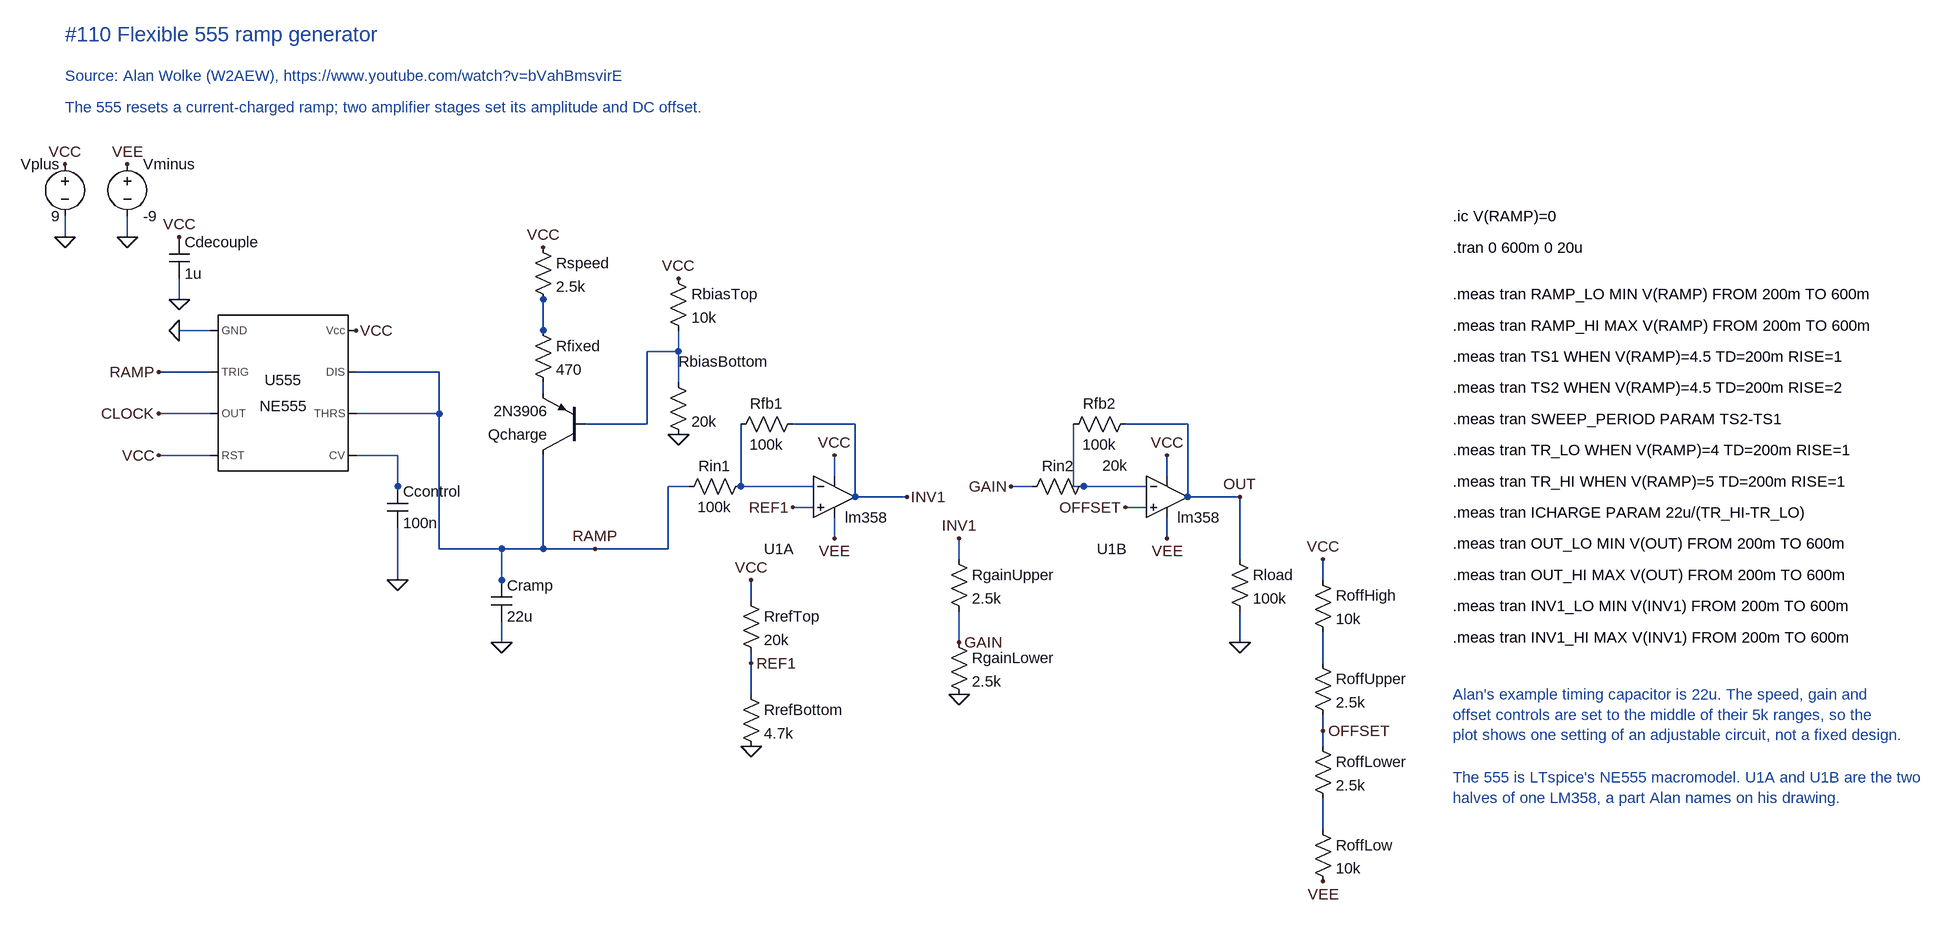
[diagram p0: schematic Flexible 555 ramp generator.asc]
Flexible 555 ramp generator.asc, the LTspice schematic file:
Version 4.1
SHEET 1 2120 1540
WIRE 64 80 64 48
WIRE 160 80 160 48
WIRE 240 96 240 80
WIRE 240 176 240 144
WIRE 288 224 240 224
WIRE 288 288 208 288
WIRE 288 352 208 352
WIRE 288 416 208 416
WIRE 512 288 640 288
WIRE 640 352 640 288
WIRE 640 352 512 352
WIRE 640 560 640 352
WIRE 736 560 640 560
WIRE 992 560 800 560
WIRE 992 560 992 464
WIRE 800 560 800 416
WIRE 800 560 736 560
WIRE 736 624 736 560
WIRE 576 416 512 416
WIRE 576 480 576 416
WIRE 576 608 576 528
WIRE 736 704 736 672
WIRE 800 176 800 224
WIRE 800 320 800 304
WIRE 800 224 800 176
WIRE 1008 256 960 256
WIRE 960 368 960 256
WIRE 960 368 864 368
WIRE 1008 256 1008 224
WIRE 1008 304 1008 256
WIRE 1024 464 992 464
WIRE 1216 464 1104 464
WIRE 1104 464 1104 368
WIRE 1280 368 1184 368
WIRE 1280 480 1280 368
WIRE 1280 480 1360 480
WIRE 1216 496 1184 496
WIRE 1248 448 1248 416
WIRE 1248 544 1248 512
WIRE 1440 576 1440 544
WIRE 1440 704 1440 656
WIRE 1552 464 1520 464
WIRE 1728 464 1632 464
WIRE 1616 464 1616 368
WIRE 1632 464 1616 464
WIRE 1792 368 1696 368
WIRE 1792 480 1792 368
WIRE 1792 480 1872 480
WIRE 1728 496 1696 496
WIRE 1760 448 1760 416
WIRE 1760 544 1760 512
WIRE 1872 576 1872 480
WIRE 1872 704 1872 656
WIRE 1120 640 1120 608
WIRE 1120 736 1120 720
WIRE 1120 784 1120 736
WIRE 2000 608 2000 576
WIRE 2000 736 2000 688
WIRE 2000 864 2000 816
WIRE 2000 992 2000 944
FLAG 64 -32 VCC
FLAG 64 80 0
FLAG 160 -32 VEE
FLAG 160 80 0
FLAG 240 80 VCC
FLAG 240 176 0
FLAG 240 224 0
FLAG 208 288 RAMP
FLAG 208 352 CLOCK
FLAG 208 416 VCC
FLAG 512 224 VCC
FLAG 576 608 0
FLAG 736 704 0
FLAG 800 96 VCC
FLAG 1008 144 VCC
FLAG 1008 384 0
FLAG 880 560 RAMP
FLAG 1184 496 REF1
FLAG 1248 416 VCC
FLAG 1248 544 VEE
FLAG 1360 480 INV1
FLAG 1440 544 INV1
FLAG 1440 704 GAIN
FLAG 1440 784 0
FLAG 1520 464 GAIN
FLAG 1696 496 OFFSET
FLAG 1760 416 VCC
FLAG 1760 544 VEE
FLAG 1872 480 OUT
FLAG 1872 704 0
FLAG 1120 608 VCC
FLAG 1120 736 REF1
FLAG 1120 864 0
FLAG 2000 576 VCC
FLAG 2000 840 OFFSET
FLAG 2000 1072 VEE
SYMBOL voltage 64 -48 R0
WINDOW 0 -8 16 Right 2
WINDOW 3 -8 96 Right 2
SYMATTR InstName Vplus
SYMATTR Value 9
SYMBOL voltage 160 -48 R0
SYMATTR InstName Vminus
SYMATTR Value -9
SYMBOL cap 224 80 R0
SYMATTR InstName Cdecouple
SYMATTR Value 1u
SYMBOL Misc\NE555 400 320 R0
SYMATTR InstName U555
SYMATTR Value NE555
SYMBOL cap 560 464 R0
SYMATTR InstName Ccontrol
SYMATTR Value 100n
SYMBOL cap 720 608 R0
SYMATTR InstName Cramp
SYMATTR Value 22u
SYMBOL res 784 80 R0
SYMATTR InstName Rspeed
SYMATTR Value 2.5k
SYMBOL res 784 208 R0
SYMATTR InstName Rfixed
SYMATTR Value 470
SYMBOL pnp 864 416 R180
SYMATTR InstName Qcharge
SYMATTR Value 2N3906
SYMBOL res 992 128 R0
SYMATTR InstName RbiasTop
SYMATTR Value 10k
SYMBOL res 992 288 R0
WINDOW 0 16 -16 Left 2
SYMATTR InstName RbiasBottom
SYMATTR Value 20k
SYMBOL res 1120 448 R90
WINDOW 0 0 56 VBottom 2
WINDOW 3 32 56 VTop 2
SYMATTR InstName Rin1
SYMATTR Value 100k
SYMBOL res 1200 352 R90
WINDOW 0 0 56 VBottom 2
WINDOW 3 32 56 VTop 2
SYMATTR InstName Rfb1
SYMATTR Value 100k
SYMBOL lm358 1248 416 R0
WINDOW 0 -108 144 Left 2
WINDOW 38 -108 176 Left 2
SYMATTR InstName U1A
SYMBOL res 1104 624 R0
SYMATTR InstName RrefTop
SYMATTR Value 20k
SYMBOL res 1104 768 R0
SYMATTR InstName RrefBottom
SYMATTR Value 4.7k
SYMBOL res 1424 560 R0
SYMATTR InstName RgainUpper
SYMATTR Value 2.5k
SYMBOL res 1424 688 R0
SYMATTR InstName RgainLower
SYMATTR Value 2.5k
SYMBOL res 1648 448 R90
WINDOW 0 0 56 VBottom 2
WINDOW 3 -32 -32 VTop 2
SYMATTR InstName Rin2
SYMATTR Value 20k
SYMBOL res 1712 352 R90
WINDOW 0 0 56 VBottom 2
WINDOW 3 32 56 VTop 2
SYMATTR InstName Rfb2
SYMATTR Value 100k
SYMBOL lm358 1760 416 R0
WINDOW 0 -108 144 Left 2
WINDOW 38 -108 176 Left 2
SYMATTR InstName U1B
SYMBOL res 1856 560 R0
SYMATTR InstName Rload
SYMATTR Value 100k
SYMBOL res 1984 592 R0
SYMATTR InstName RoffHigh
SYMATTR Value 10k
SYMBOL res 1984 720 R0
SYMATTR InstName RoffUpper
SYMATTR Value 2.5k
SYMBOL res 1984 848 R0
SYMATTR InstName RoffLower
SYMATTR Value 2.5k
SYMBOL res 1984 976 R0
SYMATTR InstName RoffLow
SYMATTR Value 10k
TEXT 64 -232 Left 3 ;#110 Flexible 555 ramp generator
TEXT 64 -168 Left 2 ;Source: Alan Wolke (W2AEW), https://www.youtube.com/watch?v=bVahBmsvirE
TEXT 64 -120 Left 2 ;The 555 resets a current-charged ramp; two amplifier stages set its amplitude and DC offset.
TEXT 2200 48 Left 2 !.ic V(RAMP)=0
TEXT 2200 96 Left 2 !.tran 0 600m 0 20u
TEXT 2200 168 Left 2 !.meas tran RAMP_LO MIN V(RAMP) FROM 200m TO 600m
TEXT 2200 216 Left 2 !.meas tran RAMP_HI MAX V(RAMP) FROM 200m TO 600m
TEXT 2200 264 Left 2 !.meas tran TS1 WHEN V(RAMP)=4.5 TD=200m RISE=1
TEXT 2200 312 Left 2 !.meas tran TS2 WHEN V(RAMP)=4.5 TD=200m RISE=2
TEXT 2200 360 Left 2 !.meas tran SWEEP_PERIOD PARAM TS2-TS1
TEXT 2200 408 Left 2 !.meas tran TR_LO WHEN V(RAMP)=4 TD=200m RISE=1
TEXT 2200 456 Left 2 !.meas tran TR_HI WHEN V(RAMP)=5 TD=200m RISE=1
TEXT 2200 504 Left 2 !.meas tran ICHARGE PARAM 22u/(TR_HI-TR_LO)
TEXT 2200 552 Left 2 !.meas tran OUT_LO MIN V(OUT) FROM 200m TO 600m
TEXT 2200 600 Left 2 !.meas tran OUT_HI MAX V(OUT) FROM 200m TO 600m
TEXT 2200 648 Left 2 !.meas tran INV1_LO MIN V(INV1) FROM 200m TO 600m
TEXT 2200 696 Left 2 !.meas tran INV1_HI MAX V(INV1) FROM 200m TO 600m
TEXT 2200 784 Left 2 ;Alan's example timing capacitor is 22u. The speed, gain and\noffset controls are set to the middle of their 5k ranges, so the\nplot shows one setting of an adjustable circuit, not a fixed design.
TEXT 2200 912 Left 2 ;The 555 is LTspice's NE555 macromodel. U1A and U1B are the two\nhalves of one LM358, a part Alan names on his drawing.

The netlist it stands for:
* Flexible 555 ramp generator.asc
Vplus VCC 0 9
Vminus VEE 0 -9
Cdecouple VCC 0 1u
X§U555 0 RAMP CLOCK VCC N001 RAMP RAMP VCC NE555  ; pins GND TRIG OUT RST CV THRS DIS Vcc
Ccontrol N001 0 100n
Cramp RAMP 0 22u
Rspeed VCC N002 2.5k
Rfixed N002 N003 470
Qcharge RAMP N004 N003 0 2N3906
RbiasTop VCC N004 10k
RbiasBottom N004 0 20k
Rin1 N005 RAMP 100k
Rfb1 INV1 N005 100k
* U1A: lm358 (symbol lm358 not available, pins judged from their places): In+=REF1 In-=N005 V+=VCC V-=VEE OUT=INV1
RrefTop VCC REF1 20k
RrefBottom REF1 0 4.7k
RgainUpper INV1 GAIN 2.5k
RgainLower GAIN 0 2.5k
Rin2 N006 GAIN 20k
Rfb2 OUT N006 100k
* U1B: lm358 (symbol lm358 not available, pins judged from their places): In+=OFFSET In-=N006 V+=VCC V-=VEE OUT=OUT
Rload OUT 0 100k
RoffHigh VCC N007 10k
RoffUpper N007 OFFSET 2.5k
RoffLower OFFSET N008 2.5k
RoffLow N008 VEE 10k
.model NPN NPN
.model PNP PNP
.lib standard.bjt
* #110 Flexible 555 ramp generator
* Source: Alan Wolke (W2AEW), https://www.youtube.com/watch?v=bVahBmsvirE
* The 555 resets a current-charged ramp; two amplifier stages set its amplitude and DC offset.
.ic V(RAMP)=0
.tran 0 600m 0 20u
.meas tran RAMP_LO MIN V(RAMP) FROM 200m TO 600m
.meas tran RAMP_HI MAX V(RAMP) FROM 200m TO 600m
.meas tran TS1 WHEN V(RAMP)=4.5 TD=200m RISE=1
.meas tran TS2 WHEN V(RAMP)=4.5 TD=200m RISE=2
.meas tran SWEEP_PERIOD PARAM TS2-TS1
.meas tran TR_LO WHEN V(RAMP)=4 TD=200m RISE=1
.meas tran TR_HI WHEN V(RAMP)=5 TD=200m RISE=1
.meas tran ICHARGE PARAM 22u/(TR_HI-TR_LO)
.meas tran OUT_LO MIN V(OUT) FROM 200m TO 600m
.meas tran OUT_HI MAX V(OUT) FROM 200m TO 600m
.meas tran INV1_LO MIN V(INV1) FROM 200m TO 600m
.meas tran INV1_HI MAX V(INV1) FROM 200m TO 600m
* Alan's example timing capacitor is 22u. The speed, gain and
* offset controls are set to the middle of their 5k ranges, so the
* plot shows one setting of an adjustable circuit, not a fixed design.
* The 555 is LTspice's NE555 macromodel. U1A and U1B are the two
* halves of one LM358, a part Alan names on his drawing.
.lib NE555.sub
.backanno
.end